# Altium schematic sheet QuarterBridge_verL.SchDoc
size A2
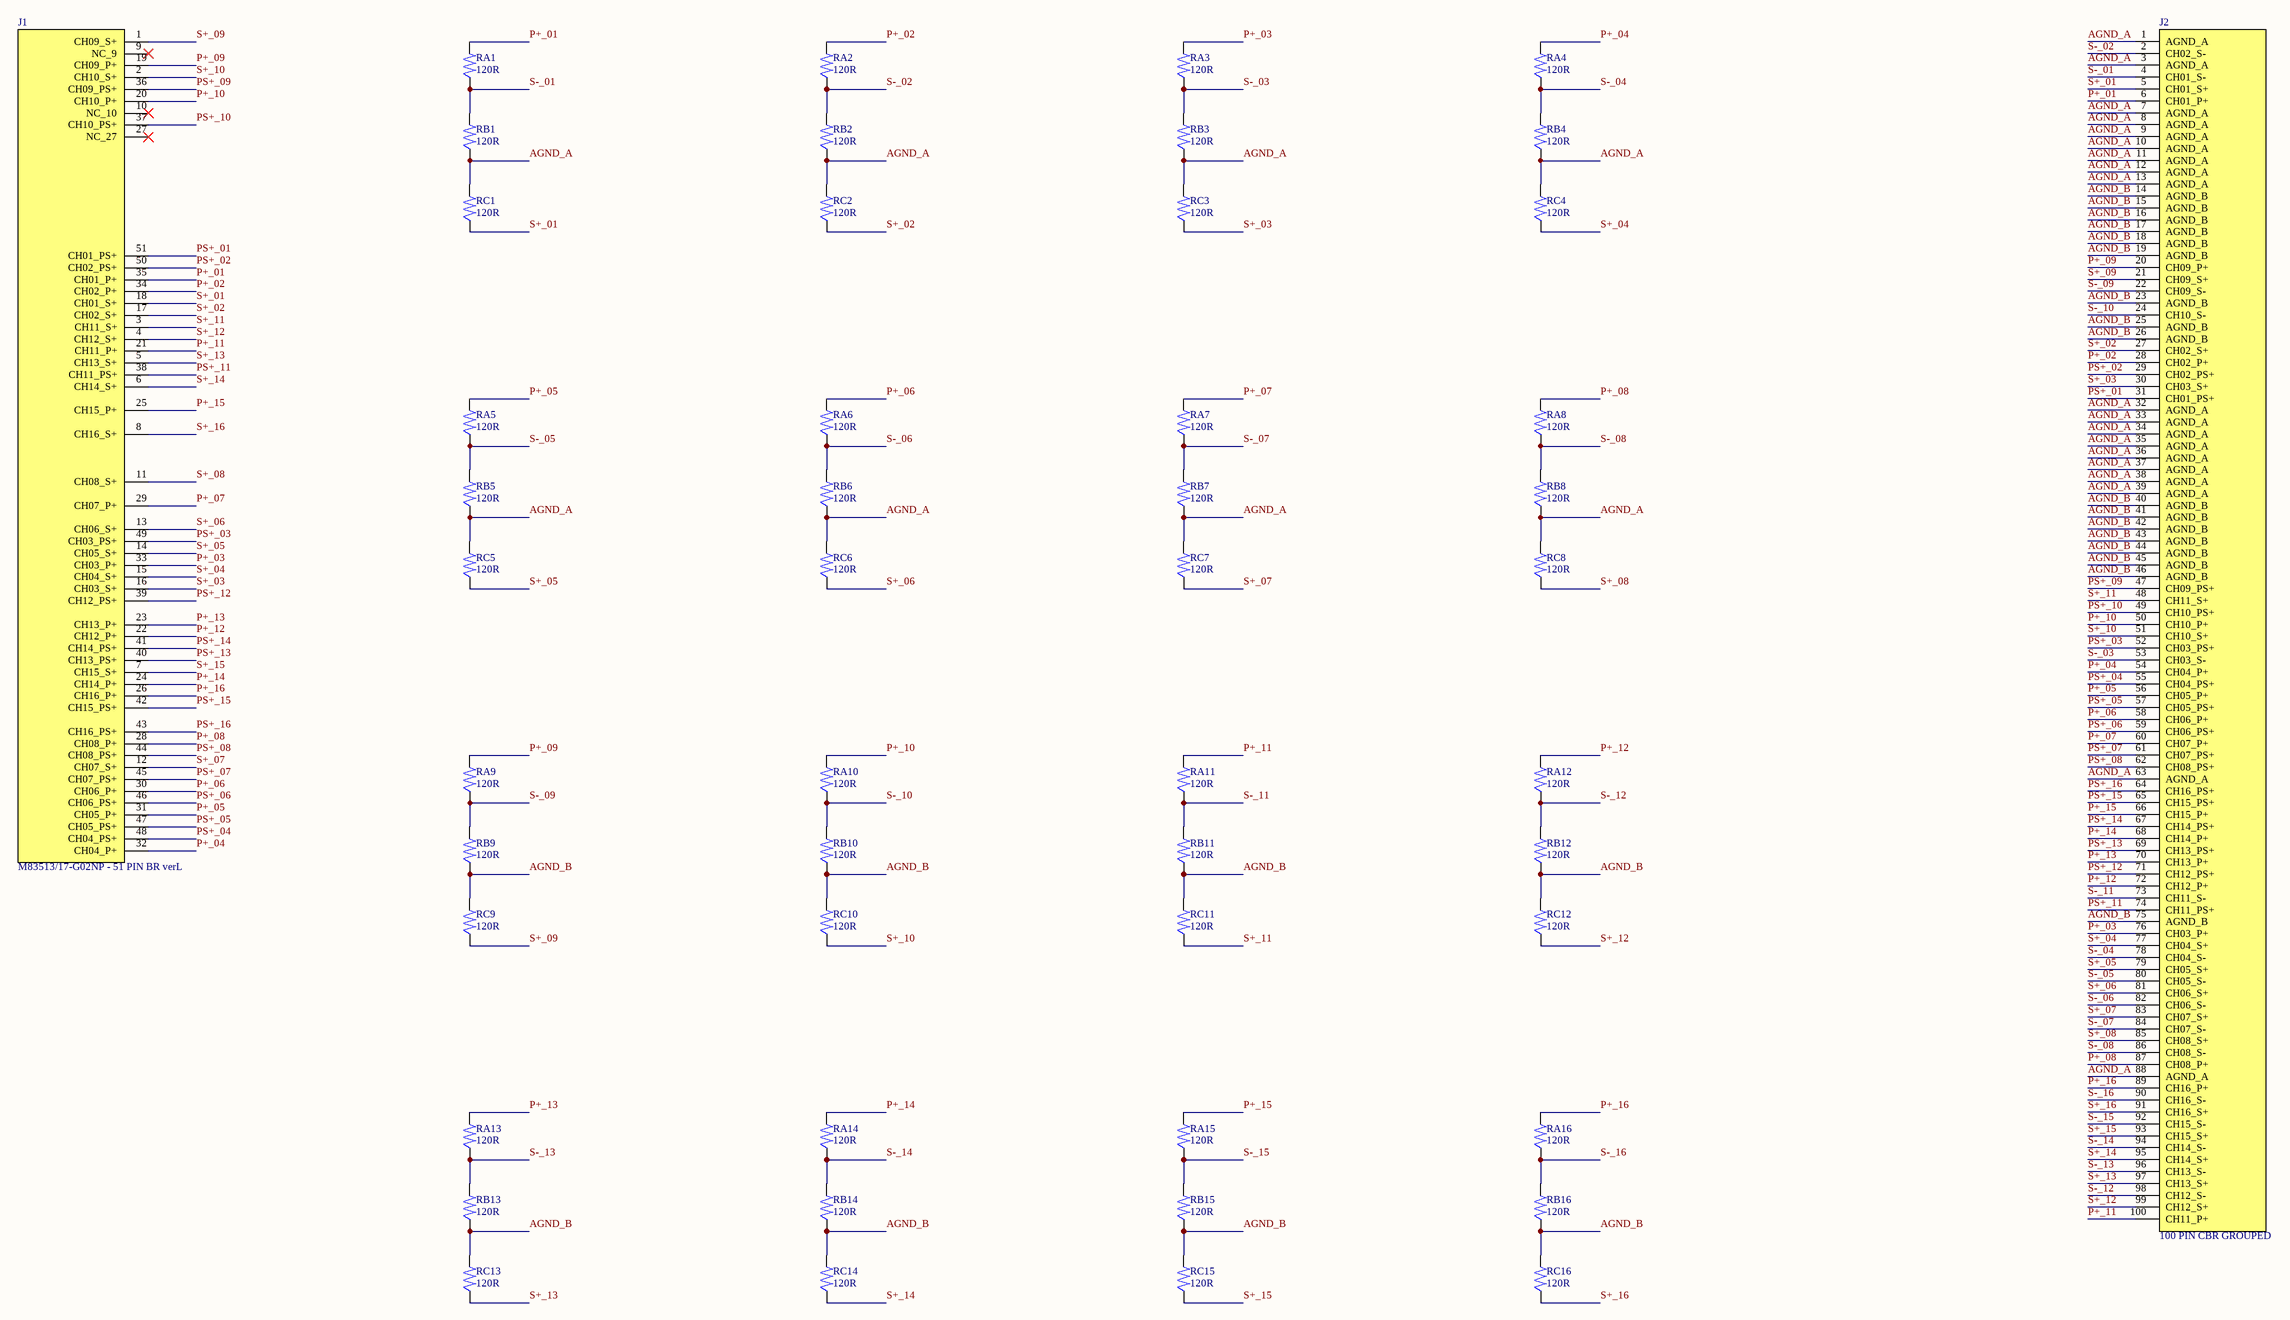
[diagram p0: QuarterBridge_verL.SchDoc]

## Parts
J1  M83513/17-G02NP - 51 PIN BR verL  [QB51_BR_PIN_VERL]
J2  100 PIN CBR GROUPED  [QB69_CBR100_PIN_R1]
RA1  120R  [QB69_TNPU1206_R1]
RA2  120R  [QB69_TNPU1206_R1]
RA3  120R  [QB69_TNPU1206_R1]
RA4  120R  [QB69_TNPU1206_R1]
RA5  120R  [QB69_TNPU1206_R1]
RA6  120R  [QB69_TNPU1206_R1]
RA7  120R  [QB69_TNPU1206_R1]
RA8  120R  [QB69_TNPU1206_R1]
RA9  120R  [QB69_TNPU1206_R1]
RA10  120R  [QB69_TNPU1206_R1]
RA11  120R  [QB69_TNPU1206_R1]
RA12  120R  [QB69_TNPU1206_R1]
RA13  120R  [QB69_TNPU1206_R1]
RA14  120R  [QB69_TNPU1206_R1]
RA15  120R  [QB69_TNPU1206_R1]
RA16  120R  [QB69_TNPU1206_R1]
RB1  120R  [QB69_TNPU1206_R1]
RB2  120R  [QB69_TNPU1206_R1]
RB3  120R  [QB69_TNPU1206_R1]
RB4  120R  [QB69_TNPU1206_R1]
RB5  120R  [QB69_TNPU1206_R1]
RB6  120R  [QB69_TNPU1206_R1]
RB7  120R  [QB69_TNPU1206_R1]
RB8  120R  [QB69_TNPU1206_R1]
RB9  120R  [QB69_TNPU1206_R1]
RB10  120R  [QB69_TNPU1206_R1]
RB11  120R  [QB69_TNPU1206_R1]
RB12  120R  [QB69_TNPU1206_R1]
RB13  120R  [QB69_TNPU1206_R1]
RB14  120R  [QB69_TNPU1206_R1]
RB15  120R  [QB69_TNPU1206_R1]
RB16  120R  [QB69_TNPU1206_R1]
RC1  120R  [QB69_TNPU1206_R1]
RC2  120R  [QB69_TNPU1206_R1]
RC3  120R  [QB69_TNPU1206_R1]
RC4  120R  [QB69_TNPU1206_R1]
RC5  120R  [QB69_TNPU1206_R1]
RC6  120R  [QB69_TNPU1206_R1]
RC7  120R  [QB69_TNPU1206_R1]
RC8  120R  [QB69_TNPU1206_R1]
RC9  120R  [QB69_TNPU1206_R1]
RC10  120R  [QB69_TNPU1206_R1]
RC11  120R  [QB69_TNPU1206_R1]
RC12  120R  [QB69_TNPU1206_R1]
RC13  120R  [QB69_TNPU1206_R1]
RC14  120R  [QB69_TNPU1206_R1]
RC15  120R  [QB69_TNPU1206_R1]
RC16  120R  [QB69_TNPU1206_R1]

## Nets
AGND_A: J2.1(AGND_A) J2.3(AGND_A) J2.7(AGND_A) J2.8(AGND_A) J2.9(AGND_A) J2.10(AGND_A) J2.11(AGND_A) J2.12(AGND_A) J2.13(AGND_A) J2.32(AGND_A) J2.33(AGND_A) J2.34(AGND_A) J2.35(AGND_A) J2.36(AGND_A) J2.37(AGND_A) J2.38(AGND_A) J2.39(AGND_A) J2.63(AGND_A) J2.88(AGND_A) RB1.2 RB2.2 RB3.2 RB4.2 RB5.2 RB6.2 RB7.2 RB8.2 RC1.1 RC2.1 RC3.1 RC4.1 RC5.1 RC6.1 RC7.1 RC8.1
AGND_B: J2.14(AGND_B) J2.15(AGND_B) J2.16(AGND_B) J2.17(AGND_B) J2.18(AGND_B) J2.19(AGND_B) J2.23(AGND_B) J2.25(AGND_B) J2.26(AGND_B) J2.40(AGND_B) J2.41(AGND_B) J2.42(AGND_B) J2.43(AGND_B) J2.44(AGND_B) J2.45(AGND_B) J2.46(AGND_B) J2.75(AGND_B) RB9.2 RB10.2 RB11.2 RB12.2 RB13.2 RB14.2 RB15.2 RB16.2 RC9.1 RC10.1 RC11.1 RC12.1 RC13.1 RC14.1 RC15.1 RC16.1
P+_01: J1.35(CH01_P+) J2.6(CH01_P+) RA1.1
P+_02: J1.34(CH02_P+) J2.28(CH02_P+) RA2.1
P+_03: J1.33(CH03_P+) J2.76(CH03_P+) RA3.1
P+_04: J1.32(CH04_P+) J2.54(CH04_P+) RA4.1
P+_05: J1.31(CH05_P+) J2.56(CH05_P+) RA5.1
P+_06: J1.30(CH06_P+) J2.58(CH06_P+) RA6.1
P+_07: J1.29(CH07_P+) J2.60(CH07_P+) RA7.1
P+_08: J1.28(CH08_P+) J2.87(CH08_P+) RA8.1
P+_09: J1.19(CH09_P+) J2.20(CH09_P+) RA9.1
P+_10: J1.20(CH10_P+) J2.50(CH10_P+) RA10.1
P+_11: J1.21(CH11_P+) J2.100(CH11_P+) RA11.1
P+_12: J1.22(CH12_P+) J2.72(CH12_P+) RA12.1
P+_13: J1.23(CH13_P+) J2.70(CH13_P+) RA13.1
P+_14: J1.24(CH14_P+) J2.68(CH14_P+) RA14.1
P+_15: J1.25(CH15_P+) J2.66(CH15_P+) RA15.1
P+_16: J1.26(CH16_P+) J2.89(CH16_P+) RA16.1
PS+_01: J1.51(CH01_PS+) J2.31(CH01_PS+)
PS+_02: J1.50(CH02_PS+) J2.29(CH02_PS+)
PS+_03: J1.49(CH03_PS+) J2.52(CH03_PS+)
PS+_04: J1.48(CH04_PS+) J2.55(CH04_PS+)
PS+_05: J1.47(CH05_PS+) J2.57(CH05_PS+)
PS+_06: J1.46(CH06_PS+) J2.59(CH06_PS+)
PS+_07: J1.45(CH07_PS+) J2.61(CH07_PS+)
PS+_08: J1.44(CH08_PS+) J2.62(CH08_PS+)
PS+_09: J1.36(CH09_PS+) J2.47(CH09_PS+)
PS+_10: J1.37(CH10_PS+) J2.49(CH10_PS+)
PS+_11: J1.38(CH11_PS+) J2.74(CH11_PS+)
PS+_12: J1.39(CH12_PS+) J2.71(CH12_PS+)
PS+_13: J1.40(CH13_PS+) J2.69(CH13_PS+)
PS+_14: J1.41(CH14_PS+) J2.67(CH14_PS+)
PS+_15: J1.42(CH15_PS+) J2.65(CH15_PS+)
PS+_16: J1.43(CH16_PS+) J2.64(CH16_PS+)
S+_01: J1.18(CH01_S+) J2.5(CH01_S+) RC1.2
S+_02: J1.17(CH02_S+) J2.27(CH02_S+) RC2.2
S+_03: J1.16(CH03_S+) J2.30(CH03_S+) RC3.2
S+_04: J1.15(CH04_S+) J2.77(CH04_S+) RC4.2
S+_05: J1.14(CH05_S+) J2.79(CH05_S+) RC5.2
S+_06: J1.13(CH06_S+) J2.81(CH06_S+) RC6.2
S+_07: J1.12(CH07_S+) J2.83(CH07_S+) RC7.2
S+_08: J1.11(CH08_S+) J2.85(CH08_S+) RC8.2
S+_09: J1.1(CH09_S+) J2.21(CH09_S+) RC9.2
S+_10: J1.2(CH10_S+) J2.51(CH10_S+) RC10.2
S+_11: J1.3(CH11_S+) J2.48(CH11_S+) RC11.2
S+_12: J1.4(CH12_S+) J2.99(CH12_S+) RC12.2
S+_13: J1.5(CH13_S+) J2.97(CH13_S+) RC13.2
S+_14: J1.6(CH14_S+) J2.95(CH14_S+) RC14.2
S+_15: J1.7(CH15_S+) J2.93(CH15_S+) RC15.2
S+_16: J1.8(CH16_S+) J2.91(CH16_S+) RC16.2
S-_01: J2.4(CH01_S-) RA1.2 RB1.1
S-_02: J2.2(CH02_S-) RA2.2 RB2.1
S-_03: J2.53(CH03_S-) RA3.2 RB3.1
S-_04: J2.78(CH04_S-) RA4.2 RB4.1
S-_05: J2.80(CH05_S-) RA5.2 RB5.1
S-_06: J2.82(CH06_S-) RA6.2 RB6.1
S-_07: J2.84(CH07_S-) RA7.2 RB7.1
S-_08: J2.86(CH08_S-) RA8.2 RB8.1
S-_09: J2.22(CH09_S-) RA9.2 RB9.1
S-_10: J2.24(CH10_S-) RA10.2 RB10.1
S-_11: J2.73(CH11_S-) RA11.2 RB11.1
S-_12: J2.98(CH12_S-) RA12.2 RB12.1
S-_13: J2.96(CH13_S-) RA13.2 RB13.1
S-_14: J2.94(CH14_S-) RA14.2 RB14.1
S-_15: J2.92(CH15_S-) RA15.2 RB15.1
S-_16: J2.90(CH16_S-) RA16.2 RB16.1

Not connected (* = marked no-connect by the designer): J1 9(NC_9)* 10(NC_10)* 27(NC_27)*

## Library data of the parts
J1 = QB51_BR_INPUT_VERL: 51-pin BR right-angle male, odd channels Top, even Bottom, NC 9,10,27; Manufacturer: Amphenol Canada; MPN: M83513/17-G02NP; Datasheet: https://www.amphenolcanada.com/wp-content/uploads/2026/02/Micro-D-Catalog-rev-17-02-26.pdf
J2 = QB100_MIRROR_OUTPUT_VERL: Auto planar assignment; physical CBR PIN footprint unchanged
RA1 = TNPU1206120RAZEN00_ANSI_1: Vishay TNPU1206120RAZEN00; 120 ohm, 0.05%, 5ppm/K, 1206; Channel: CH01; BridgeRole: RA; GroundBank: AGND_A; PCB_Side: Top; MPN: TNPU1206120RAZEN00; Manufacturer: Vishay; Package: 1206; Tolerance: 0.05%; TCR: 5 ppm/K
RA2 = TNPU1206120RAZEN00_ANSI_1: Vishay TNPU1206120RAZEN00; 120 ohm, 0.05%, 5ppm/K, 1206; Channel: CH02; BridgeRole: RA; GroundBank: AGND_A; PCB_Side: Bottom; MPN: TNPU1206120RAZEN00; Manufacturer: Vishay; Package: 1206; Tolerance: 0.05%; TCR: 5 ppm/K
RA3 = TNPU1206120RAZEN00_ANSI_1: Vishay TNPU1206120RAZEN00; 120 ohm, 0.05%, 5ppm/K, 1206; Channel: CH03; BridgeRole: RA; GroundBank: AGND_A; PCB_Side: Top; MPN: TNPU1206120RAZEN00; Manufacturer: Vishay; Package: 1206; Tolerance: 0.05%; TCR: 5 ppm/K
RA4 = TNPU1206120RAZEN00_ANSI_1: Vishay TNPU1206120RAZEN00; 120 ohm, 0.05%, 5ppm/K, 1206; Channel: CH04; BridgeRole: RA; GroundBank: AGND_A; PCB_Side: Bottom; MPN: TNPU1206120RAZEN00; Manufacturer: Vishay; Package: 1206; Tolerance: 0.05%; TCR: 5 ppm/K
RA5 = TNPU1206120RAZEN00_ANSI_1: Vishay TNPU1206120RAZEN00; 120 ohm, 0.05%, 5ppm/K, 1206; Channel: CH05; BridgeRole: RA; GroundBank: AGND_A; PCB_Side: Top; MPN: TNPU1206120RAZEN00; Manufacturer: Vishay; Package: 1206; Tolerance: 0.05%; TCR: 5 ppm/K
RA6 = TNPU1206120RAZEN00_ANSI_1: Vishay TNPU1206120RAZEN00; 120 ohm, 0.05%, 5ppm/K, 1206; Channel: CH06; BridgeRole: RA; GroundBank: AGND_A; PCB_Side: Bottom; MPN: TNPU1206120RAZEN00; Manufacturer: Vishay; Package: 1206; Tolerance: 0.05%; TCR: 5 ppm/K
RA7 = TNPU1206120RAZEN00_ANSI_1: Vishay TNPU1206120RAZEN00; 120 ohm, 0.05%, 5ppm/K, 1206; Channel: CH07; BridgeRole: RA; GroundBank: AGND_A; PCB_Side: Top; MPN: TNPU1206120RAZEN00; Manufacturer: Vishay; Package: 1206; Tolerance: 0.05%; TCR: 5 ppm/K
RA8 = TNPU1206120RAZEN00_ANSI_1: Vishay TNPU1206120RAZEN00; 120 ohm, 0.05%, 5ppm/K, 1206; Channel: CH08; BridgeRole: RA; GroundBank: AGND_A; PCB_Side: Bottom; MPN: TNPU1206120RAZEN00; Manufacturer: Vishay; Package: 1206; Tolerance: 0.05%; TCR: 5 ppm/K
RA9 = TNPU1206120RAZEN00_ANSI_1: Vishay TNPU1206120RAZEN00; 120 ohm, 0.05%, 5ppm/K, 1206; Channel: CH09; BridgeRole: RA; GroundBank: AGND_B; PCB_Side: Top; MPN: TNPU1206120RAZEN00; Manufacturer: Vishay; Package: 1206; Tolerance: 0.05%; TCR: 5 ppm/K
RA10 = TNPU1206120RAZEN00_ANSI_1: Vishay TNPU1206120RAZEN00; 120 ohm, 0.05%, 5ppm/K, 1206; Channel: CH10; BridgeRole: RA; GroundBank: AGND_B; PCB_Side: Bottom; MPN: TNPU1206120RAZEN00; Manufacturer: Vishay; Package: 1206; Tolerance: 0.05%; TCR: 5 ppm/K
RA11 = TNPU1206120RAZEN00_ANSI_1: Vishay TNPU1206120RAZEN00; 120 ohm, 0.05%, 5ppm/K, 1206; Channel: CH11; BridgeRole: RA; GroundBank: AGND_B; PCB_Side: Top; MPN: TNPU1206120RAZEN00; Manufacturer: Vishay; Package: 1206; Tolerance: 0.05%; TCR: 5 ppm/K
RA12 = TNPU1206120RAZEN00_ANSI_1: Vishay TNPU1206120RAZEN00; 120 ohm, 0.05%, 5ppm/K, 1206; Channel: CH12; BridgeRole: RA; GroundBank: AGND_B; PCB_Side: Bottom; MPN: TNPU1206120RAZEN00; Manufacturer: Vishay; Package: 1206; Tolerance: 0.05%; TCR: 5 ppm/K
RA13 = TNPU1206120RAZEN00_ANSI_1: Vishay TNPU1206120RAZEN00; 120 ohm, 0.05%, 5ppm/K, 1206; Channel: CH13; BridgeRole: RA; GroundBank: AGND_B; PCB_Side: Top; MPN: TNPU1206120RAZEN00; Manufacturer: Vishay; Package: 1206; Tolerance: 0.05%; TCR: 5 ppm/K
RA14 = TNPU1206120RAZEN00_ANSI_1: Vishay TNPU1206120RAZEN00; 120 ohm, 0.05%, 5ppm/K, 1206; Channel: CH14; BridgeRole: RA; GroundBank: AGND_B; PCB_Side: Bottom; MPN: TNPU1206120RAZEN00; Manufacturer: Vishay; Package: 1206; Tolerance: 0.05%; TCR: 5 ppm/K
RA15 = TNPU1206120RAZEN00_ANSI_1: Vishay TNPU1206120RAZEN00; 120 ohm, 0.05%, 5ppm/K, 1206; Channel: CH15; BridgeRole: RA; GroundBank: AGND_B; PCB_Side: Top; MPN: TNPU1206120RAZEN00; Manufacturer: Vishay; Package: 1206; Tolerance: 0.05%; TCR: 5 ppm/K
RA16 = TNPU1206120RAZEN00_ANSI_1: Vishay TNPU1206120RAZEN00; 120 ohm, 0.05%, 5ppm/K, 1206; Channel: CH16; BridgeRole: RA; GroundBank: AGND_B; PCB_Side: Bottom; MPN: TNPU1206120RAZEN00; Manufacturer: Vishay; Package: 1206; Tolerance: 0.05%; TCR: 5 ppm/K
RB1 = TNPU1206120RAZEN00_ANSI_1: Vishay TNPU1206120RAZEN00; 120 ohm, 0.05%, 5ppm/K, 1206; Channel: CH01; BridgeRole: RB; GroundBank: AGND_A; PCB_Side: Top; MPN: TNPU1206120RAZEN00; Manufacturer: Vishay; Package: 1206; Tolerance: 0.05%; TCR: 5 ppm/K
RB2 = TNPU1206120RAZEN00_ANSI_1: Vishay TNPU1206120RAZEN00; 120 ohm, 0.05%, 5ppm/K, 1206; Channel: CH02; BridgeRole: RB; GroundBank: AGND_A; PCB_Side: Bottom; MPN: TNPU1206120RAZEN00; Manufacturer: Vishay; Package: 1206; Tolerance: 0.05%; TCR: 5 ppm/K
RB3 = TNPU1206120RAZEN00_ANSI_1: Vishay TNPU1206120RAZEN00; 120 ohm, 0.05%, 5ppm/K, 1206; Channel: CH03; BridgeRole: RB; GroundBank: AGND_A; PCB_Side: Top; MPN: TNPU1206120RAZEN00; Manufacturer: Vishay; Package: 1206; Tolerance: 0.05%; TCR: 5 ppm/K
RB4 = TNPU1206120RAZEN00_ANSI_1: Vishay TNPU1206120RAZEN00; 120 ohm, 0.05%, 5ppm/K, 1206; Channel: CH04; BridgeRole: RB; GroundBank: AGND_A; PCB_Side: Bottom; MPN: TNPU1206120RAZEN00; Manufacturer: Vishay; Package: 1206; Tolerance: 0.05%; TCR: 5 ppm/K
RB5 = TNPU1206120RAZEN00_ANSI_1: Vishay TNPU1206120RAZEN00; 120 ohm, 0.05%, 5ppm/K, 1206; Channel: CH05; BridgeRole: RB; GroundBank: AGND_A; PCB_Side: Top; MPN: TNPU1206120RAZEN00; Manufacturer: Vishay; Package: 1206; Tolerance: 0.05%; TCR: 5 ppm/K
RB6 = TNPU1206120RAZEN00_ANSI_1: Vishay TNPU1206120RAZEN00; 120 ohm, 0.05%, 5ppm/K, 1206; Channel: CH06; BridgeRole: RB; GroundBank: AGND_A; PCB_Side: Bottom; MPN: TNPU1206120RAZEN00; Manufacturer: Vishay; Package: 1206; Tolerance: 0.05%; TCR: 5 ppm/K
RB7 = TNPU1206120RAZEN00_ANSI_1: Vishay TNPU1206120RAZEN00; 120 ohm, 0.05%, 5ppm/K, 1206; Channel: CH07; BridgeRole: RB; GroundBank: AGND_A; PCB_Side: Top; MPN: TNPU1206120RAZEN00; Manufacturer: Vishay; Package: 1206; Tolerance: 0.05%; TCR: 5 ppm/K
RB8 = TNPU1206120RAZEN00_ANSI_1: Vishay TNPU1206120RAZEN00; 120 ohm, 0.05%, 5ppm/K, 1206; Channel: CH08; BridgeRole: RB; GroundBank: AGND_A; PCB_Side: Bottom; MPN: TNPU1206120RAZEN00; Manufacturer: Vishay; Package: 1206; Tolerance: 0.05%; TCR: 5 ppm/K
RB9 = TNPU1206120RAZEN00_ANSI_1: Vishay TNPU1206120RAZEN00; 120 ohm, 0.05%, 5ppm/K, 1206; Channel: CH09; BridgeRole: RB; GroundBank: AGND_B; PCB_Side: Top; MPN: TNPU1206120RAZEN00; Manufacturer: Vishay; Package: 1206; Tolerance: 0.05%; TCR: 5 ppm/K
RB10 = TNPU1206120RAZEN00_ANSI_1: Vishay TNPU1206120RAZEN00; 120 ohm, 0.05%, 5ppm/K, 1206; Channel: CH10; BridgeRole: RB; GroundBank: AGND_B; PCB_Side: Bottom; MPN: TNPU1206120RAZEN00; Manufacturer: Vishay; Package: 1206; Tolerance: 0.05%; TCR: 5 ppm/K
RB11 = TNPU1206120RAZEN00_ANSI_1: Vishay TNPU1206120RAZEN00; 120 ohm, 0.05%, 5ppm/K, 1206; Channel: CH11; BridgeRole: RB; GroundBank: AGND_B; PCB_Side: Top; MPN: TNPU1206120RAZEN00; Manufacturer: Vishay; Package: 1206; Tolerance: 0.05%; TCR: 5 ppm/K
RB12 = TNPU1206120RAZEN00_ANSI_1: Vishay TNPU1206120RAZEN00; 120 ohm, 0.05%, 5ppm/K, 1206; Channel: CH12; BridgeRole: RB; GroundBank: AGND_B; PCB_Side: Bottom; MPN: TNPU1206120RAZEN00; Manufacturer: Vishay; Package: 1206; Tolerance: 0.05%; TCR: 5 ppm/K
RB13 = TNPU1206120RAZEN00_ANSI_1: Vishay TNPU1206120RAZEN00; 120 ohm, 0.05%, 5ppm/K, 1206; Channel: CH13; BridgeRole: RB; GroundBank: AGND_B; PCB_Side: Top; MPN: TNPU1206120RAZEN00; Manufacturer: Vishay; Package: 1206; Tolerance: 0.05%; TCR: 5 ppm/K
RB14 = TNPU1206120RAZEN00_ANSI_1: Vishay TNPU1206120RAZEN00; 120 ohm, 0.05%, 5ppm/K, 1206; Channel: CH14; BridgeRole: RB; GroundBank: AGND_B; PCB_Side: Bottom; MPN: TNPU1206120RAZEN00; Manufacturer: Vishay; Package: 1206; Tolerance: 0.05%; TCR: 5 ppm/K
RB15 = TNPU1206120RAZEN00_ANSI_1: Vishay TNPU1206120RAZEN00; 120 ohm, 0.05%, 5ppm/K, 1206; Channel: CH15; BridgeRole: RB; GroundBank: AGND_B; PCB_Side: Top; MPN: TNPU1206120RAZEN00; Manufacturer: Vishay; Package: 1206; Tolerance: 0.05%; TCR: 5 ppm/K
RB16 = TNPU1206120RAZEN00_ANSI_1: Vishay TNPU1206120RAZEN00; 120 ohm, 0.05%, 5ppm/K, 1206; Channel: CH16; BridgeRole: RB; GroundBank: AGND_B; PCB_Side: Bottom; MPN: TNPU1206120RAZEN00; Manufacturer: Vishay; Package: 1206; Tolerance: 0.05%; TCR: 5 ppm/K
RC1 = TNPU1206120RAZEN00_ANSI_1: Vishay TNPU1206120RAZEN00; 120 ohm, 0.05%, 5ppm/K, 1206; Channel: CH01; BridgeRole: RC; GroundBank: AGND_A; PCB_Side: Top; MPN: TNPU1206120RAZEN00; Manufacturer: Vishay; Package: 1206; Tolerance: 0.05%; TCR: 5 ppm/K
RC2 = TNPU1206120RAZEN00_ANSI_1: Vishay TNPU1206120RAZEN00; 120 ohm, 0.05%, 5ppm/K, 1206; Channel: CH02; BridgeRole: RC; GroundBank: AGND_A; PCB_Side: Bottom; MPN: TNPU1206120RAZEN00; Manufacturer: Vishay; Package: 1206; Tolerance: 0.05%; TCR: 5 ppm/K
RC3 = TNPU1206120RAZEN00_ANSI_1: Vishay TNPU1206120RAZEN00; 120 ohm, 0.05%, 5ppm/K, 1206; Channel: CH03; BridgeRole: RC; GroundBank: AGND_A; PCB_Side: Top; MPN: TNPU1206120RAZEN00; Manufacturer: Vishay; Package: 1206; Tolerance: 0.05%; TCR: 5 ppm/K
RC4 = TNPU1206120RAZEN00_ANSI_1: Vishay TNPU1206120RAZEN00; 120 ohm, 0.05%, 5ppm/K, 1206; Channel: CH04; BridgeRole: RC; GroundBank: AGND_A; PCB_Side: Bottom; MPN: TNPU1206120RAZEN00; Manufacturer: Vishay; Package: 1206; Tolerance: 0.05%; TCR: 5 ppm/K
RC5 = TNPU1206120RAZEN00_ANSI_1: Vishay TNPU1206120RAZEN00; 120 ohm, 0.05%, 5ppm/K, 1206; Channel: CH05; BridgeRole: RC; GroundBank: AGND_A; PCB_Side: Top; MPN: TNPU1206120RAZEN00; Manufacturer: Vishay; Package: 1206; Tolerance: 0.05%; TCR: 5 ppm/K
RC6 = TNPU1206120RAZEN00_ANSI_1: Vishay TNPU1206120RAZEN00; 120 ohm, 0.05%, 5ppm/K, 1206; Channel: CH06; BridgeRole: RC; GroundBank: AGND_A; PCB_Side: Bottom; MPN: TNPU1206120RAZEN00; Manufacturer: Vishay; Package: 1206; Tolerance: 0.05%; TCR: 5 ppm/K
RC7 = TNPU1206120RAZEN00_ANSI_1: Vishay TNPU1206120RAZEN00; 120 ohm, 0.05%, 5ppm/K, 1206; Channel: CH07; BridgeRole: RC; GroundBank: AGND_A; PCB_Side: Top; MPN: TNPU1206120RAZEN00; Manufacturer: Vishay; Package: 1206; Tolerance: 0.05%; TCR: 5 ppm/K
RC8 = TNPU1206120RAZEN00_ANSI_1: Vishay TNPU1206120RAZEN00; 120 ohm, 0.05%, 5ppm/K, 1206; Channel: CH08; BridgeRole: RC; GroundBank: AGND_A; PCB_Side: Bottom; MPN: TNPU1206120RAZEN00; Manufacturer: Vishay; Package: 1206; Tolerance: 0.05%; TCR: 5 ppm/K
RC9 = TNPU1206120RAZEN00_ANSI_1: Vishay TNPU1206120RAZEN00; 120 ohm, 0.05%, 5ppm/K, 1206; Channel: CH09; BridgeRole: RC; GroundBank: AGND_B; PCB_Side: Top; MPN: TNPU1206120RAZEN00; Manufacturer: Vishay; Package: 1206; Tolerance: 0.05%; TCR: 5 ppm/K
RC10 = TNPU1206120RAZEN00_ANSI_1: Vishay TNPU1206120RAZEN00; 120 ohm, 0.05%, 5ppm/K, 1206; Channel: CH10; BridgeRole: RC; GroundBank: AGND_B; PCB_Side: Bottom; MPN: TNPU1206120RAZEN00; Manufacturer: Vishay; Package: 1206; Tolerance: 0.05%; TCR: 5 ppm/K
RC11 = TNPU1206120RAZEN00_ANSI_1: Vishay TNPU1206120RAZEN00; 120 ohm, 0.05%, 5ppm/K, 1206; Channel: CH11; BridgeRole: RC; GroundBank: AGND_B; PCB_Side: Top; MPN: TNPU1206120RAZEN00; Manufacturer: Vishay; Package: 1206; Tolerance: 0.05%; TCR: 5 ppm/K
RC12 = TNPU1206120RAZEN00_ANSI_1: Vishay TNPU1206120RAZEN00; 120 ohm, 0.05%, 5ppm/K, 1206; Channel: CH12; BridgeRole: RC; GroundBank: AGND_B; PCB_Side: Bottom; MPN: TNPU1206120RAZEN00; Manufacturer: Vishay; Package: 1206; Tolerance: 0.05%; TCR: 5 ppm/K
RC13 = TNPU1206120RAZEN00_ANSI_1: Vishay TNPU1206120RAZEN00; 120 ohm, 0.05%, 5ppm/K, 1206; Channel: CH13; BridgeRole: RC; GroundBank: AGND_B; PCB_Side: Top; MPN: TNPU1206120RAZEN00; Manufacturer: Vishay; Package: 1206; Tolerance: 0.05%; TCR: 5 ppm/K
RC14 = TNPU1206120RAZEN00_ANSI_1: Vishay TNPU1206120RAZEN00; 120 ohm, 0.05%, 5ppm/K, 1206; Channel: CH14; BridgeRole: RC; GroundBank: AGND_B; PCB_Side: Bottom; MPN: TNPU1206120RAZEN00; Manufacturer: Vishay; Package: 1206; Tolerance: 0.05%; TCR: 5 ppm/K
RC15 = TNPU1206120RAZEN00_ANSI_1: Vishay TNPU1206120RAZEN00; 120 ohm, 0.05%, 5ppm/K, 1206; Channel: CH15; BridgeRole: RC; GroundBank: AGND_B; PCB_Side: Top; MPN: TNPU1206120RAZEN00; Manufacturer: Vishay; Package: 1206; Tolerance: 0.05%; TCR: 5 ppm/K
RC16 = TNPU1206120RAZEN00_ANSI_1: Vishay TNPU1206120RAZEN00; 120 ohm, 0.05%, 5ppm/K, 1206; Channel: CH16; BridgeRole: RC; GroundBank: AGND_B; PCB_Side: Bottom; MPN: TNPU1206120RAZEN00; Manufacturer: Vishay; Package: 1206; Tolerance: 0.05%; TCR: 5 ppm/K